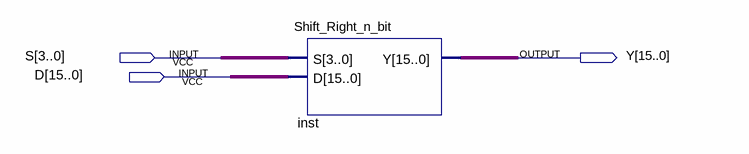
[diagram p0: schematic sheet]
// Quartus schematic test_shift.bdf as structural Verilog: 1 symbols, 3 pins
module test_shift (
  input  [3:0] S,
  input  [15:0] D,
  output [15:0] Y
);

  Shift_Right_n_bit inst (.S(S), .D(D), .Y(Y));
endmodule
